# Altium schematic sheet Power_Sheet.SchDoc
size A4; SheetNumber: 2; SheetTotal: 3
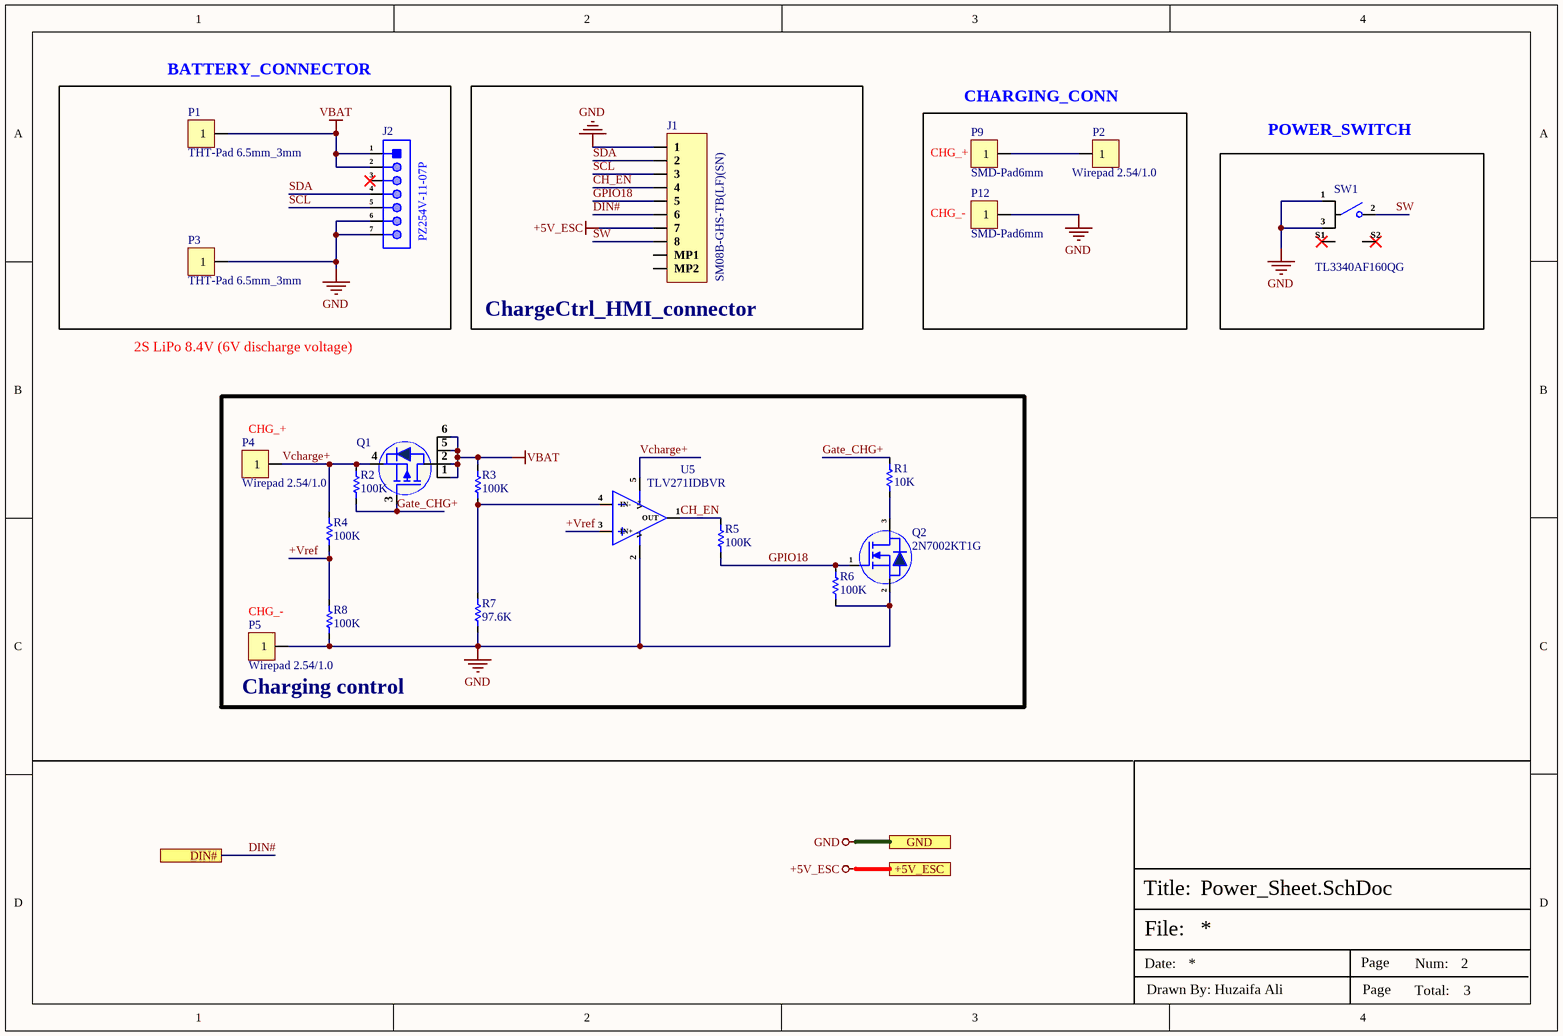
[diagram p0: Power_Sheet.SchDoc]

## Parts
J1  SM08B-GHS-TB(LF)(SN)  [SM08B-GHS-TB(LF)(SN)]
J2  PZ254V-11-07P  [HDR 1X7]
P1  THT-Pad 6.5mm_3mm  [THT-Pad 6.5mm/Hole Size 3mm]  (no BOM)
P2  Wirepad 2.54/1.0  [Wirepad 2.54/1.0]  (no BOM)
P3  THT-Pad 6.5mm_3mm  [THT-Pad 6.5mm/Hole Size 3mm]  (no BOM)
P4  Wirepad 2.54/1.0  [Wirepad 2.54/1.0]  (no BOM)
P5  Wirepad 2.54/1.0  [Wirepad 2.54/1.0]  (no BOM)
P9  SMD-Pad6mm  [6.0mm-SMD Pad]  (no BOM)
P12  SMD-Pad6mm  [6.0mm-SMD Pad]  (no BOM)
Q1  IRLTS2242TRPBF  [6-TSOP_]  (value not drawn)
Q2  2N7002KT1G  [SOT-23]
R1  10K  [Res-0402]
R2  100K  [Res-0402]
R3  100K  [Res-0402]
R4  100K  [Res-0402]
R5  100K  [Res-0402]
R6  100K  [Res-0402]
R7  97.6K  [Res-0402]
R8  100K  [Res-0402]
SW1  TL3340AF160QG  [TL3340AF160QG]
U5  TLV271IDBVR  [SOT-23-5]

## Blocks framed on the sheet
BATTERY_CONNECTOR: J2 P1 P3
ChargeCtrl_HMI_connector: J1
CHARGING_CONN: P2 P9 P12
POWER_SWITCH: SW1
Charging control: P4 P5 Q1 Q2 R1-R8 U5

## Ports
+5V_ESC (see Top-Sheet[2B], HMI Led's_Sheet[3D]), DIN# (see Top-Sheet[2B], HMI Led's_Sheet[1D]), GND (see Top-Sheet[2B], HMI Led's_Sheet[3D])

## Nets
+5V_ESC: J1.7 ; port +5V_ESC
GND: J1.1 J2.6 J2.7 P3.1 P5.1 P12.1 Q2.2(S) R6.2 R7.1 R8.2 SW1.1(COM_1) SW1.3(COM_2) U5.2(V-) ; port GND
VBAT: J2.1 J2.2 P1.1 Q1.1(D) Q1.2(D) Q1.5(D) Q1.6(D) R3.1
+Vref: R4.2 R8.1 U5.3(IN+)
CH_EN: J1.4 R5.1 U5.1(OUT)
DIN#: J1.6 ; port DIN#
Gate_CHG+: Q1.3(G) R1.2 R2.2
GPIO18: J1.5 Q2.1(G) R5.2 R6.1
SCL: J1.3 J2.5
SDA: J1.2 J2.4
SW: J1.8 SW1.2(NO)
Vcharge+: P4.1 Q1.4(S) R2.1 R4.1 U5.5(V+)
NetP2_1: P2.1 P9.1
NetQ2_3: Q2.3(D) R1.1
NetR3_2: R3.2 R7.2 U5.4(IN-)

Not connected (* = marked no-connect by the designer): J1 MP1 MP2; J2 3*; SW1 S1(GND)* S2(GND)*

## Notes on the sheet
- (near P9) CHG_+
- (near P12) CHG_-
- 2S LiPo 8.4V (6V discharge voltage)
- (near P4) CHG_+
- (near P5) CHG_-
- File:
- Title:
- Date:
- Page
- Num:
- Total:
- Drawn By: Huzaifa Ali

## Library data of the parts
J1 = SM08B-GHS-TB(LF)(SN): CONN HEADER SMD R/A 8POS 1.25MM; Manufacturer: JST; Item Type: Connectors; Number of Positions: 8; Current Rating: 1A; Voltage Rating: 50V; Supplier: Arrow Electronics; LCSC Part Number: C265111; Manufacturer Part Number: SM08B-GHS-TB(LF)(SN); RoHS: Yes; Stock: 5000; Pricing: 2500=0.3128, 5000=0.3063 (USD); Mounting Technology: Surface Mount; Contact Material: Bronze; Contact Shape: Rectangular; Contact Finish - Mating: TIN; Insulation Material: Nylon; Insulation Color: Natural; Housing Color: 50Colour; Housing Material: 4261ConductorMaterial; Packaging: Cut Tape; Number of Rows: 1; Termination: Solder; Fastening Type: Ramp; Connector Type: Header; Series: GH; Contact Type: Outer Shroud Contact; Number of Contacts: 8; Orientation: Right Angle; Pitch: 1.25mm; Flammability Rating: UL94 V-0; Lead Free: 5697LeadFree; ComponentLink1URL: https://datasheet.ciiva.com/25617/0900766b810cef18-25617249.pdf?src-supplier=Rs; ComponentLink1Description: https://datasheet.ciiva.com/25617/0900766b810cef18-25617249.pdf?src-supplier=Rs; ComponentLink2URL: https://datasheet.ciiva.com/16290/jst20sm08b-ghs-tb-lf-sn-16290511.pdf?src-supplier=Future+Electronics; ComponentLink2Description: https://datasheet.ciiva.com/16290/jst20sm08b-ghs-tb-lf-sn-16290511.pdf?src-supplier=Future+Electronics
J2 = PZ254V-11-07P: DNP; Manufacturer: XFCN; Item Type: Header; Manufacturer Part Number: PZ254V-11-07P; LCSC Part Number: C492406; Package: 2.54mm; ComponentLink1Description: LCSC; ComponentLink1URL: https://www.lcsc.com/product-detail/Pin-Headers_XFCN-PZ254V-11-07P_C492406.html
P1 P3 = THT-Pad 6.5mm/Hole Size 3mm
Q1 = IRLTS2242TRPBF: MOSFET P-CH 20V 6.9A 6TSOP; Manufacturer: Infineon; Item Type: MOSFETs; Turn-Off Delay Time: 18ns; Turn-On Delay Time: 5.8ns; Drain to Source Breakdown Voltage: -20V; Drain to Source Resistance: 26mR; Element Configuration: 5460ElementConfiguration; Fall Time: 68ns; Number of Channels: 1NUMBER; On-State Resistance: -32mR; Power Dissipation: 2W; Value: 55MR; Supplier: Mouser; LCSC Part Number: C538190; Manufacturer Part Number: IRLTS2242TRPBF; RoHS: Yes; Stock: 67736; Pricing: 1=0.44, 10=0.372, 50=0.372, 100=0.259, 1000=0.164, 10000=0.129 (USD); Number of Elements: 1NUMBER; Package Quantity: 3000NUMBER; Length: 3mm; Width: 1.75mm; Height: 1.3mm; Radiation Hardening: 5898YesNo; ComponentLink1URL: http://www.farnell.com/datasheets/1911990.pdf?src-supplier=Farnell; ComponentLink1Description: http://www.farnell.com/datasheets/1911990.pdf?src-supplier=Farnell; ComponentLink2URL: http://www.farnell.com/datasheets/1911990.pdf?src-supplier=Element14; ComponentLink2Description: http://www.farnell.com/datasheets/1911990.pdf?src-supplier=Element14; ComponentLink3URL: https://datasheet.octopart.com/IRLTS2242TRPBF-Infineon-datasheet-41193307.pdf?src-supplier=Newark; ComponentLink3Description: https://datasheet.octopart.com/IRLTS2242TRPBF-Infineon-datasheet-41193307.pdf?src-supplier=Newark; ComponentLink4URL: https://www.infineon.com/dgdl/irlts2242pbf.pdf?fileId=5546d462533600a401535671e9a12718&src-supplier=Digikey; ComponentLink4Description: https://www.infineon.com/dgdl/irlts2242pbf.pdf?fileId=5546d462533600a401535671e9a12718&src-supplier=Digikey; ComponentLink5URL: https://datasheet.octopart.com/IRLTS2242TRPBF-Infineon-datasheet-11534477.pdf?src-supplier=Farnell; ComponentLink5Description: https://datasheet.octopart.com/IRLTS2242TRPBF-Infineon-datasheet-11534477.pdf?src-supplier=Farnell
Q2 = 2N7002KT1G: MOSFET N-CH 60V 320MA SOT23-3; Manufacturer: ON Semiconductor; Input Capacitance: 24.5pF; Max Power Dissipation: 420mW; Rds On Max: 1.6R; Rise Time: 9ns; Nominal Vgs: 2.3V; Number of Elements: 1; Power Dissipation: 300mW; Turn-Off Delay Time: 55.8ns; Turn-On Delay Time: 12.2ns; Element Configuration: Single; Gate to Source Voltage (Vgs): 20V; Polarity: N-CHANNEL; Number of Channels: 1NUMBER; Supplier: Future Electronics; Supplier Part Number: 3445699; Manufacturer Part Number: 2N7002KT1G; RoHS: Yes; Category: MOSFETs; Stock: 51000; Pricing: 3000=0.0238, 12000=0.0228, 45000=0.0218, 75000=0.0215, 150000=0.0204 (USD); Case/Package: SOT-23-3; Pins: 3; Contact Plating: Tin,Matte; Min Operating Temperature: -55°C; Max Operating Temperature: 150°C; Packaging: Tape and Reel; Continuous Drain Current (ID): 320mA; Package Quantity: 1; Drain to Source Breakdown Voltage: 60V; Fall Time: 9ns; Drain to Source Resistance: 1.6R; Threshold Voltage: 2.3V; Series: -; Drain-source On Resistance-Max: 1.6R; Length: 3.04mm; Width: 1.4mm; Height: 1.01mm; Radiation Hardening: No; Reach SVHC Compliant: No; Lead Free: Lead Free; Halogen Free: Halogen Free; RoHS Compliant: Yes; ComponentLink1URL: https://datasheet.ciiva.com/1254/2n7002k-d-1254499.pdf?src-supplier=Newark; ComponentLink1Description: https://datasheet.ciiva.com/1254/2n7002k-d-1254499.pdf?src-supplier=Newark; ComponentLink2URL: https://datasheet.ciiva.com/16220/2n7002k-d-16220919.pdf?src-supplier=Future+Electronics; ComponentLink2Description: https://datasheet.ciiva.com/16220/2n7002k-d-16220919.pdf?src-supplier=Future+Electronics; ComponentLink3URL: https://datasheet.ciiva.com/936/2n7002k-d-936793.pdf?src-supplier=Digikey; ComponentLink3Description: https://datasheet.ciiva.com/936/2n7002k-d-936793.pdf?src-supplier=Digikey; LCSC Part Number: C116584; Item Type: MOSFET
R1 = RC0402FR-0710KL: RES 10K OHM 1% 1/16W 0402; Manufacturer: Yageo; Resistance: 10kR; Voltage Rating (DC): 50V; Temperature Coefficient: 100ppm/°C; Power Rating: 62.5mW; Max Power Dissipation: 63mW; Item Type: Resistor; Supplier 1: Mouser; Manufacturer Part Number: RC0402FR-0710KL; RoHS: Yes; Category: Chip SMD Resistors; Stock 1: 18648329; Pricing 1: 1=0.10000, 10=0.01400, 50=0.01400, 100=0.00500, 1000=0.00300, 10000=0.00200 (USD); Case/Package: 0402; Number of Pins: 2; Case Code (Imperial): 0402; Case Code (Metric): 1005; Min Operating Temperature: -55°C; Max Operating Temperature: 155°C; Resistor Type: Thick Film; Tolerance: 1%; Packaging: Tape and Reel; Voltage Rating: 50V; Termination: SMD/SMT; Working Voltage: 50V; Number of Terminations: 2; Features: Moisture Resistant; Series: RC; Resistance Tolerance: 1%; Construction: Rectangular; Length: 1mm; Width: 0.5mm; Height: 0.32mm; Depth: 0.5mm; Lead Pitch: 0.2mm; REACH SVHC: No SVHC; Lead Free: Lead Free; RoHS Compliant: Yes; Military Standard: Not; ComponentLink1URL: https://datasheet.ciiva.com/7660/38568-7660787.pdf?src-supplier=Element14; ComponentLink1Description: https://datasheet.ciiva.com/7660/38568-7660787.pdf?src-supplier=Element14; ComponentLink2URL: https://datasheet.ciiva.com/7849/1686128-7849814.pdf?src-supplier=Element14; ComponentLink2Description: https://datasheet.ciiva.com/7849/1686128-7849814.pdf?src-supplier=Element14; ComponentLink3URL: https://datasheet.ciiva.com/7983/1018594-7983486.pdf?src-supplier=Element14; ComponentLink3Description: https://datasheet.ciiva.com/7983/1018594-7983486.pdf?src-supplier=Element14; ComponentLink4URL: https://datasheet.ciiva.com/22747/1018594-22747512.pdf?src-supplier=Element14; ComponentLink4Description: https://datasheet.ciiva.com/22747/1018594-22747512.pdf?src-supplier=Element14; ComponentLink5URL: https://datasheet.ciiva.com/12667/pyu-rc0402-51-rohs-l-6-r-12667067.pdf?src-supplier=Mouser; ComponentLink5Description: https://datasheet.ciiva.com/12667/pyu-rc0402-51-rohs-l-6-r-12667067.pdf?src-supplier=Mouser; ComponentLink6URL: https://datasheet.ciiva.com/7849/1784430-7849813.pdf?src-supplier=Element14; ComponentLink6Description: https://datasheet.ciiva.com/7849/1784430-7849813.pdf?src-supplier=Element14; ComponentLink7URL: https://datasheet.ciiva.com/7849/1784430-7849815.pdf?src-supplier=Element14; ComponentLink7Description: https://datasheet.ciiva.com/7849/1784430-7849815.pdf?src-supplier=Element14; Supplier Part Number 1: 603-RC0402FR-0710KL; LCSC Part Number: C60490
R2-R6 R8 = RC0402FR-07100KL: RES 100K OHM 1% 1/16W 0402; Manufacturer: Yageo; Resistance: 100kR; Temperature Coefficient: 100ppm/°C; Power Rating: 63mW; Voltage Rating: 50V; Item Type: Resistor; Supplier 1: Mouser; Manufacturer Part Number: RC0402FR-07100KL; RoHS: Yes; Category: Chip SMD Resistors; Stock 1: 7759549; Pricing 1: 1=0.10000, 10=0.01200, 50=0.01200, 100=0.00500, 1000=0.00300, 2500=0.00200, 10000=0.00100 (USD); Case/Package: 0402; Case Code (Metric): 1005; Case Code (Imperial): 0402; Min Operating Temperature: -55°C; Max Operating Temperature: 155°C; Resistor Type: Thick Film; Tolerance: 1%; Packaging: Tape and Reel; Package Quantity: 1; Number of Terminations: 2; Termination: SMD/SMT; Max Power Dissipation: 63mW; Working Voltage: 50V; Features: Moisture Resistant; Series: RC; Resistance Tolerance: 1%; Construction: Rectangular; Technology: THICK FILM; Length: 0.039inch; Width: 0.02inch; Height: 0.016inch; Depth: 0.5mm; REACH SVHC: No SVHC; Lead Free: Lead Free; RoHS Compliant: Yes; Military Standard: Not; ComponentLink1URL: https://datasheet.ciiva.com/11819/0900766b80c66297-11819452.pdf?src-supplier=RSComponents; ComponentLink1Description: https://datasheet.ciiva.com/11819/0900766b80c66297-11819452.pdf?src-supplier=RSComponents; ComponentLink2URL: https://datasheet.ciiva.com/22747/1018594-22747509.pdf?src-supplier=Element14; ComponentLink2Description: https://datasheet.ciiva.com/22747/1018594-22747509.pdf?src-supplier=Element14; ComponentLink3URL: https://datasheet.ciiva.com/2453/pyu-r-int-thick-7-2453362.pdf?src-supplier=Digi-Key; ComponentLink3Description: https://datasheet.ciiva.com/2453/pyu-r-int-thick-7-2453362.pdf?src-supplier=Digi-Key; ComponentLink4URL: https://datasheet.ciiva.com/2453/pyu-r-int-thick-7-2453363.pdf?src-supplier=Digi-Key; ComponentLink4Description: https://datasheet.ciiva.com/2453/pyu-r-int-thick-7-2453363.pdf?src-supplier=Digi-Key; ComponentLink5URL: https://datasheet.ciiva.com/2453/pyu-r-int-thick-7-2453361.pdf?src-supplier=Digi-Key; ComponentLink5Description: https://datasheet.ciiva.com/2453/pyu-r-int-thick-7-2453361.pdf?src-supplier=Digi-Key; ComponentLink6URL: https://datasheet.ciiva.com/12667/pyu-rc0402-51-rohs-l-6-r-12667930.pdf?src-supplier=Mouser; ComponentLink6Description: https://datasheet.ciiva.com/12667/pyu-rc0402-51-rohs-l-6-r-12667930.pdf?src-supplier=Mouser; ComponentLink7URL: https://datasheet.ciiva.com/15189/getdatasheetpartid-323696-15189334.pdf?src-supplier=Verical; ComponentLink7Description: https://datasheet.ciiva.com/15189/getdatasheetpartid-323696-15189334.pdf?src-supplier=Verical; Supplier Part Number 1: 603-RC0402FR-07100KL; LCSC Part Number: C60491
R7 = RT0402BRD0797K6L: RES SMD 97.6KOHM 0.1% 1/16W 0402; Manufacturer: Yageo; Item Type: Resistors; Voltage Rating (DC): 50V; Supplier: Arrow Electronics; LCSC Part Number: C852964; Manufacturer Part Number: RT0402BRD0797K6L; RoHS: Yes; Stock: 301; Pricing: 1=0.0267, 10=0.0191, 25=0.0164, 100=0.0148, 250=0.0132 (USD); Lead Free: 5697LeadFree; ComponentLink1URL: https://datasheet.ciiva.com/2582/pyu-rt-1-to-0-05-rohs-l-5-2582537.pdf?src-supplier=Digikey; ComponentLink1Description: https://datasheet.ciiva.com/2582/pyu-rt-1-to-0-05-rohs-l-5-2582537.pdf?src-supplier=Digikey
SW1 = TL3340AF160QG: Switch Tactile N.O. SPST Round Button Gull Wing 0.05A 12VDC 100000Cycles 1.57N SMD; Manufacturer: E-Switch; Actuator Material: Polyphthalamide; Number of Positions: 2NUMBER; Contact Current Rating: 50mA; Operating Force: 160gf; Voltage Rating (DC): 12V; Contact Resistance: 500mR; Illumination Type: Non-Illuminated,Illuminated; Switch Travel: 0.2mm; Switch Function: Off-Mom; Actuator Type: Standard; Actuator Length: 0.85mm; Supplier: Future Electronics; Supplier Part Number: 9232661; Manufacturer Part Number: TL3340AF160QG; RoHS: Yes; Category: Tactile Switches; Stock: 16000; Pricing: 2000=0.27 (USD); Mounting Technology: Surface Mount; Case/Package: SMD/SMT; Contact Material: Stainless Steel,Silver; Contact Plating: Stainless Steel,Silver; Color: White; Mechanical Life: 100000Cycles; Housing Material: Polyphthalamide; Min Operating Temperature: -35°C; Max Operating Temperature: 85°C; Throw Configuration: SPST; Package Quantity: 1; Packaging: Tape and Reel; Current Rating: 50mA; Max Voltage Rating (DC): 12V; Termination: Gull Wing; Electrical Life: 100000Cycles; Orientation: Right Angle; Series: TL3340; Height: 3.55mm; Size: 3.3mm; Reach SVHC Compliant: No; Lead Free: 5697LeadFree; RoHS Compliant: Yes; ComponentLink1URL: https://datasheet.ciiva.com/7637/tl3340-7637667.pdf?src-supplier=Element14; ComponentLink1Description: https://datasheet.ciiva.com/7637/tl3340-7637667.pdf?src-supplier=Element14; ComponentLink2URL: https://datasheet.ciiva.com/5284/tl3340-28153-5284108.pdf?src-supplier=Mouser; ComponentLink2Description: https://datasheet.ciiva.com/5284/tl3340-28153-5284108.pdf?src-supplier=Mouser; ComponentLink3URL: https://datasheet.ciiva.com/2900/p021301b-2900825.pdf?src-supplier=Digikey; ComponentLink3Description: https://datasheet.ciiva.com/2900/p021301b-2900825.pdf?src-supplier=Digikey; ComponentLink4URL: https://datasheet.ciiva.com/2900/p021301b-2900826.pdf?src-supplier=Digikey; ComponentLink4Description: https://datasheet.ciiva.com/2900/p021301b-2900826.pdf?src-supplier=Digikey; ComponentLink5URL: https://datasheet.ciiva.com/2900/p021301b-2900827.pdf?src-supplier=Digikey; ComponentLink5Description: https://datasheet.ciiva.com/2900/p021301b-2900827.pdf?src-supplier=Digikey
U5 = TLV271IDBVR: IC CMOS 1 CIRCUIT SOT23-5; Manufacturer: Texas Instruments; Item Type: Opam; Supplier: Mouser; LCSC Part Number: C181500; Manufacturer Part Number: TLV271IDBVR; RoHS: Yes; Stock: 23196; Pricing: 1=0.9, 10=0.761, 50=0.761, 100=0.585, 1000=0.408, 10000=0.347 (USD); ComponentLink1URL: https://datasheet.ciiva.com/7848/1772259-7848320.pdf?src-supplier=Element14; ComponentLink1Description: https://datasheet.ciiva.com/7848/1772259-7848320.pdf?src-supplier=Element14; ComponentLink2URL: https://datasheet.ciiva.com/1796/tlv271-1796326.pdf?src-supplier=Digikey; ComponentLink2Description: https://datasheet.ciiva.com/1796/tlv271-1796326.pdf?src-supplier=Digikey; ComponentLink3URL: https://datasheet.ciiva.com/1796/tlv271-1796327.pdf?src-supplier=Digikey; ComponentLink3Description: https://datasheet.ciiva.com/1796/tlv271-1796327.pdf?src-supplier=Digikey; ComponentLink4URL: https://datasheet.ciiva.com/1796/tlv271-1796328.pdf?src-supplier=Digikey; ComponentLink4Description: https://datasheet.ciiva.com/1796/tlv271-1796328.pdf?src-supplier=Digikey; ComponentLink5URL: https://datasheet.ciiva.com/2974/slos351d-2974433.pdf?src-supplier=Avnet; ComponentLink5Description: https://datasheet.ciiva.com/2974/slos351d-2974433.pdf?src-supplier=Avnet; ComponentLink6URL: https://datasheet.ciiva.com/2974/slos351d-2974434.pdf?src-supplier=Avnet; ComponentLink6Description: https://datasheet.ciiva.com/2974/slos351d-2974434.pdf?src-supplier=Avnet; ComponentLink7URL: https://datasheet.ciiva.com/46383/1882561-46383869.pdf?src-supplier=Element14; ComponentLink7Description: https://datasheet.ciiva.com/46383/1882561-46383869.pdf?src-supplier=Element14